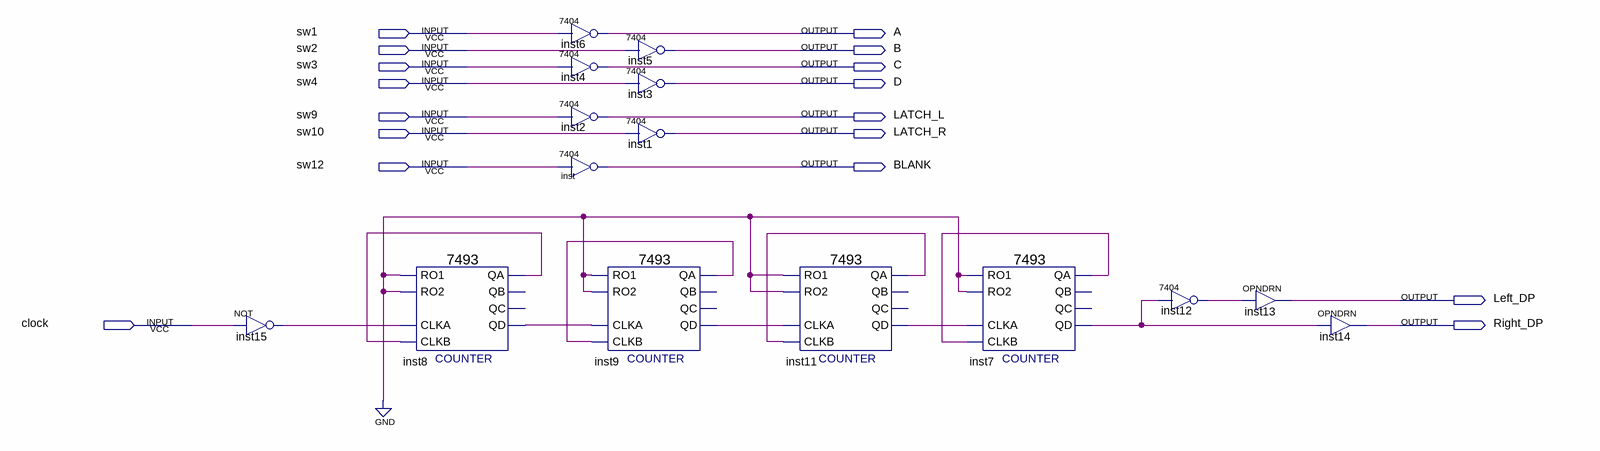
[diagram p0: schematic sheet]
// Quartus schematic boardtest.bdf as structural Verilog: 15 symbols, 17 pins
module boardtest (
  input  sw1,
  input  sw2,
  input  sw3,
  input  sw4,
  input  sw9,
  input  sw10,
  input  sw12,
  input  clock,
  output A,
  output B,
  output C,
  output D,
  output LATCH_L,
  output LATCH_R,
  output BLANK,
  output Left_DP,
  output Right_DP
);

  wire inst7_qa, inst7_qd, inst8_qa, inst8_qd, inst9_qa, inst9_qd, inst11_qa, inst11_qd, inst12_1, inst15_out;

  not inst15 (inst15_out, clock);
  \7493  inst8 (
    .RO1(1'b0), .RO2(1'b0), .CLKA(inst15_out), .CLKB(inst8_qa), .QA(inst8_qa), .QD(inst8_qd));  // open: QC, QB
  \7404  inst6 (.\2 (sw1), .\1 (A));
  \7404  inst4 (.\2 (sw3), .\1 (C));
  \7404  inst2 (.\2 (sw9), .\1 (LATCH_L));
  \7404  inst (.\2 (sw12), .\1 (BLANK));
  \7404  inst5 (.\2 (sw2), .\1 (B));
  \7404  inst3 (.\2 (sw4), .\1 (D));
  \7404  inst1 (.\2 (sw10), .\1 (LATCH_R));
  \7493  inst9 (
    .RO1(1'b0), .RO2(1'b0), .CLKA(inst8_qd), .CLKB(inst9_qa), .QA(inst9_qa), .QD(inst9_qd));  // open: QC, QB
  \7493  inst11 (
    .RO1(1'b0), .RO2(1'b0), .CLKA(inst9_qd), .CLKB(inst11_qa), .QA(inst11_qa), .QD(inst11_qd));  // open: QC, QB
  \7493  inst7 (
    .RO1(1'b0), .RO2(1'b0), .CLKA(inst11_qd), .CLKB(inst7_qa), .QA(inst7_qa), .QD(inst7_qd));  // open: QC, QB
  \7404  inst12 (.\2 (inst7_qd), .\1 (inst12_1));
  OPNDRN inst13 (.IN(inst12_1), .OUT(Left_DP));
  OPNDRN inst14 (.IN(inst7_qd), .OUT(Right_DP));
endmodule
